# Altium project CW341_KintexUltraScaleTarget.PrjPcb (part 2 of 3)

## Sheet CW341_FPGAIO_5.SchDoc: Kintex IO Banks
size Letter; Organization: NewAE Technology Inc.; Address1: 1083 Queen St., Suite 196; Address2: Halifax; Address3: NS; Address4: Canada B3H 0B2; SheetNumber: 10; SheetTotal: 16; SheetApproved: YES
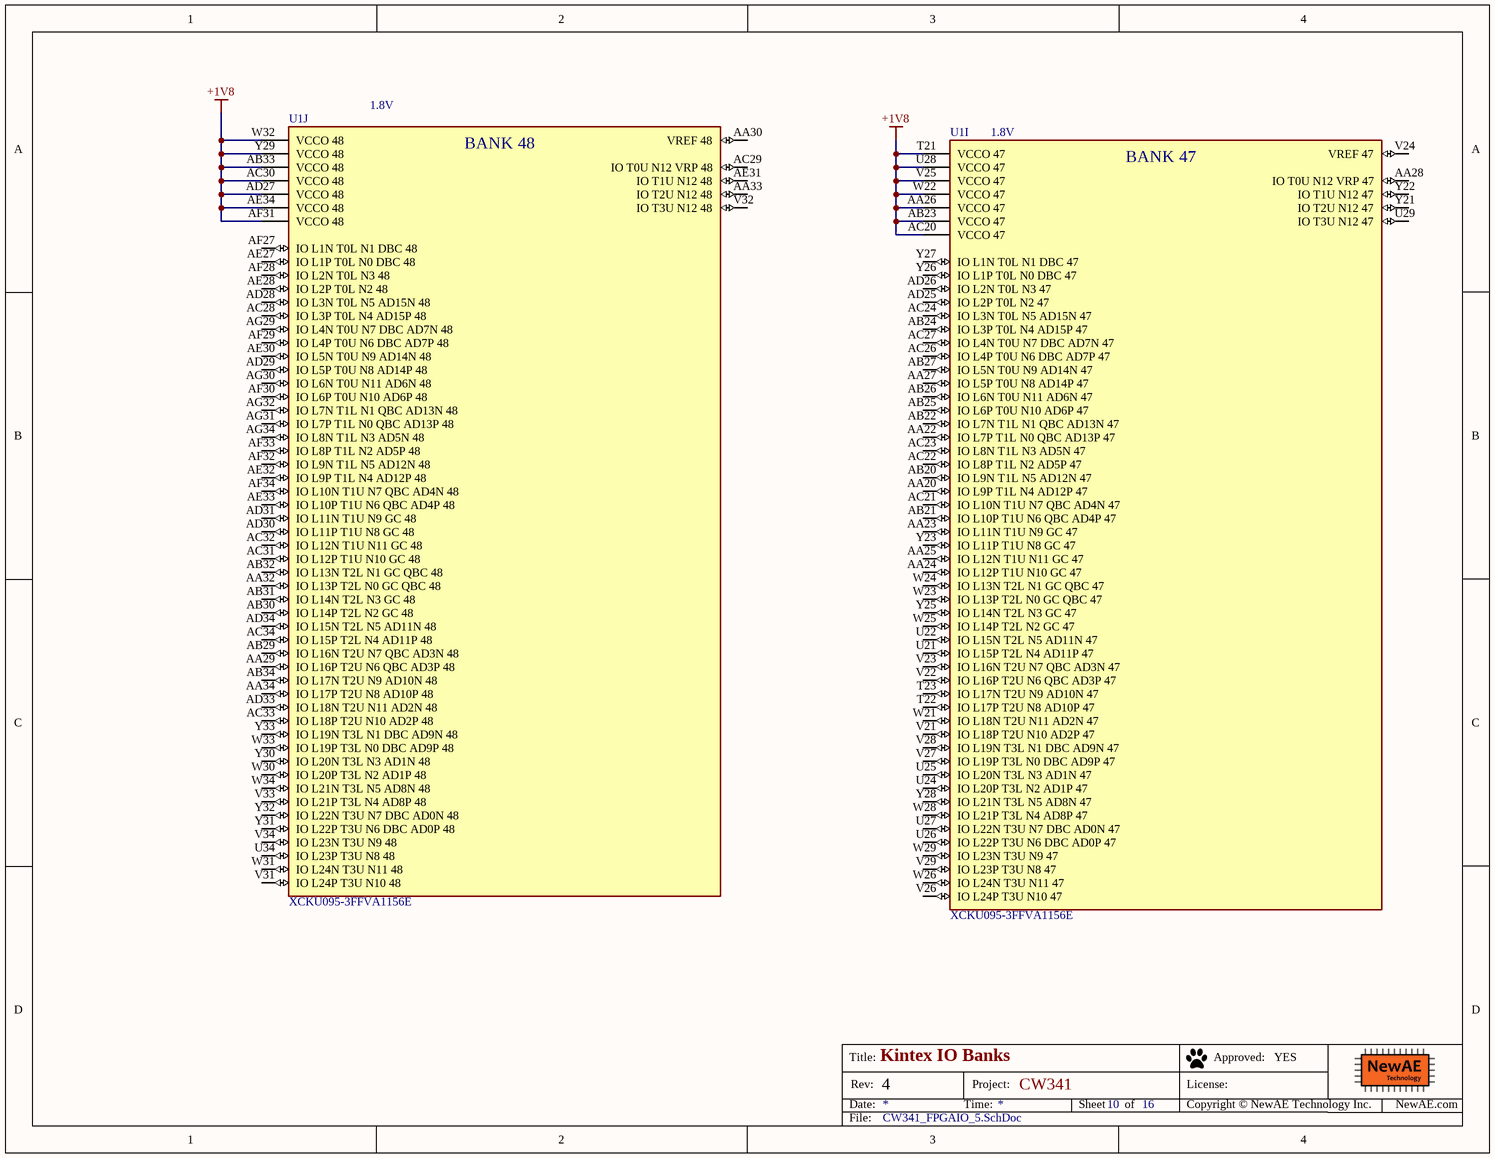
[diagram p9: CW341_FPGAIO_5.SchDoc]

### Parts
U1  XCKU095-3FFVA1156E  [FP-XCKU060-3FFVA1156E-MFG]  (parts I,J of 23)

### Nets
+1V8: U1.AA26(VCCO_47) U1.AB23(VCCO_47) U1.AB33(VCCO_48) U1.AC20(VCCO_47) U1.AC30(VCCO_48) U1.AD27(VCCO_48) U1.AE34(VCCO_48) U1.AF31(VCCO_48) U1.T21(VCCO_47) U1.U28(VCCO_47) U1.V25(VCCO_47) U1.W22(VCCO_47) U1.W32(VCCO_48) U1.Y29(VCCO_48)

Not connected (* = marked no-connect by the designer): U1 AA20(IO_L9P_T1L_N4_AD12P_47) AA22(IO_L7P_T1L_N0_QBC_AD13P_47) AA23(IO_L11N_T1U_N9_GC_47) AA24(IO_L12P_T1U_N10_GC_47) AA25(IO_L12N_T1U_N11_GC_47) AA27(IO_L5P_T0U_N8_AD14P_47) AA28(IO_T0U_N12_VRP_47) AA29(IO_L16P_T2U_N6_QBC_AD3P_48) AA30(VREF_48) AA32(IO_L13P_T2L_N0_GC_QBC_48) AA33(IO_T2U_N12_48) AA34(IO_L17P_T2U_N8_AD10P_48) AB20(IO_L9N_T1L_N5_AD12N_47) AB21(IO_L10P_T1U_N6_QBC_AD4P_47) AB22(IO_L7N_T1L_N1_QBC_AD13N_47) AB24(IO_L3P_T0L_N4_AD15P_47) AB25(IO_L6P_T0U_N10_AD6P_47) AB26(IO_L6N_T0U_N11_AD6N_47) AB27(IO_L5N_T0U_N9_AD14N_47) AB29(IO_L16N_T2U_N7_QBC_AD3N_48) AB30(IO_L14P_T2L_N2_GC_48) AB31(IO_L14N_T2L_N3_GC_48) AB32(IO_L13N_T2L_N1_GC_QBC_48) AB34(IO_L17N_T2U_N9_AD10N_48) AC21(IO_L10N_T1U_N7_QBC_AD4N_47) AC22(IO_L8P_T1L_N2_AD5P_47) AC23(IO_L8N_T1L_N3_AD5N_47) AC24(IO_L3N_T0L_N5_AD15N_47) AC26(IO_L4P_T0U_N6_DBC_AD7P_47) AC27(IO_L4N_T0U_N7_DBC_AD7N_47) AC28(IO_L3P_T0L_N4_AD15P_48) AC29(IO_T0U_N12_VRP_48) AC31(IO_L12P_T1U_N10_GC_48) AC32(IO_L12N_T1U_N11_GC_48) AC33(IO_L18P_T2U_N10_AD2P_48) AC34(IO_L15P_T2L_N4_AD11P_48) AD25(IO_L2P_T0L_N2_47) AD26(IO_L2N_T0L_N3_47) AD28(IO_L3N_T0L_N5_AD15N_48) AD29(IO_L5P_T0U_N8_AD14P_48) AD30(IO_L11P_T1U_N8_GC_48) AD31(IO_L11N_T1U_N9_GC_48) AD33(IO_L18N_T2U_N11_AD2N_48) AD34(IO_L15N_T2L_N5_AD11N_48) AE27(IO_L1P_T0L_N0_DBC_48) AE28(IO_L2P_T0L_N2_48) AE30(IO_L5N_T0U_N9_AD14N_48) AE31(IO_T1U_N12_48) AE32(IO_L9P_T1L_N4_AD12P_48) AE33(IO_L10P_T1U_N6_QBC_AD4P_48) AF27(IO_L1N_T0L_N1_DBC_48) AF28(IO_L2N_T0L_N3_48) AF29(IO_L4P_T0U_N6_DBC_AD7P_48) AF30(IO_L6P_T0U_N10_AD6P_48) AF32(IO_L9N_T1L_N5_AD12N_48) AF33(IO_L8P_T1L_N2_AD5P_48) AF34(IO_L10N_T1U_N7_QBC_AD4N_48) AG29(IO_L4N_T0U_N7_DBC_AD7N_48) AG30(IO_L6N_T0U_N11_AD6N_48) AG31(IO_L7P_T1L_N0_QBC_AD13P_48) AG32(IO_L7N_T1L_N1_QBC_AD13N_48) AG34(IO_L8N_T1L_N3_AD5N_48) T22(IO_L17P_T2U_N8_AD10P_47) T23(IO_L17N_T2U_N9_AD10N_47) U21(IO_L15P_T2L_N4_AD11P_47) U22(IO_L15N_T2L_N5_AD11N_47) U24(IO_L20P_T3L_N2_AD1P_47) U25(IO_L20N_T3L_N3_AD1N_47) U26(IO_L22P_T3U_N6_DBC_AD0P_47) U27(IO_L22N_T3U_N7_DBC_AD0N_47) U29(IO_T3U_N12_47) U34(IO_L23P_T3U_N8_48) V21(IO_L18P_T2U_N10_AD2P_47) V22(IO_L16P_T2U_N6_QBC_AD3P_47) V23(IO_L16N_T2U_N7_QBC_AD3N_47) V24(VREF_47) V26(IO_L24P_T3U_N10_47) V27(IO_L19P_T3L_N0_DBC_AD9P_47) V28(IO_L19N_T3L_N1_DBC_AD9N_47) V29(IO_L23P_T3U_N8_47) V31(IO_L24P_T3U_N10_48) V32(IO_T3U_N12_48) V33(IO_L21P_T3L_N4_AD8P_48) V34(IO_L23N_T3U_N9_48) W21(IO_L18N_T2U_N11_AD2N_47) W23(IO_L13P_T2L_N0_GC_QBC_47) W24(IO_L13N_T2L_N1_GC_QBC_47) W25(IO_L14P_T2L_N2_GC_47) W26(IO_L24N_T3U_N11_47) W28(IO_L21P_T3L_N4_AD8P_47) W29(IO_L23N_T3U_N9_47) W30(IO_L20P_T3L_N2_AD1P_48) W31(IO_L24N_T3U_N11_48) W33(IO_L19P_T3L_N0_DBC_AD9P_48) W34(IO_L21N_T3L_N5_AD8N_48) Y21(IO_T2U_N12_47) Y22(IO_T1U_N12_47) Y23(IO_L11P_T1U_N8_GC_47) Y25(IO_L14N_T2L_N3_GC_47) Y26(IO_L1P_T0L_N0_DBC_47) Y27(IO_L1N_T0L_N1_DBC_47) Y28(IO_L21N_T3L_N5_AD8N_47) Y30(IO_L20N_T3L_N3_AD1N_48) Y31(IO_L22P_T3U_N6_DBC_AD0P_48) Y32(IO_L22N_T3U_N7_DBC_AD0N_48) Y33(IO_L19N_T3L_N1_DBC_AD9N_48)

### Notes on the sheet
- (near U1) 1.8V
- Title:
- Date:
- Rev:
- Time:
- Project:
- Sheet
- of
- License:
- Copyright © NewAE Technology Inc.
- Approved:
- NewAE.com
- File:
- (in symbol IC-XCKU095-1156, part I) BANK 47
- (in symbol IC-XCKU095-1156, part J) BANK 48

### Library data of the parts
U1 = IC-XCKU095-1156: IC FPGA 520 I/O 1156FCBGA; Manufacturer: Xilinx; Manufacturer Part Number: XCKU060-3FFVA1156E; Standoff Height: 0.4mm; Ram Size: 38MBytes; Min Supply Voltage: 0.97V; Max Junction Temp: +100°C; Max Supply Voltage: 1.8V; Number Of Logic Elements Cells: 1176000; Number Of I/Os: 520; Speed Grade: 3; Memory Type: RAM; Ipc Land Pattern Name: BGA1156N100P34X34_3500X3500X342; RoHS: TRUE; Height: 3.51mm; Footprint Url: https://www.xilinx.com/support/documentation/user_guides/ug575-ultrascale-pkg-pinout.pdf; Device Class L2: Embedded Processors and Controllers; ComponentLink2URL: https://www.xilinx.com/support/documentation/data_sheets/ds890-ultrascale-overview.pdf; Temperature Range High: +100°C; Device Class L1: Integrated Circuits (ICs); Package: 0; Octopart: https://octopart.com/xcku035-3ffva1156e-xilinx-67038192?r=sp; Automotive: No; ComponentLink2Description: Datasheet; Device Class L3: FPGAs - Field Programmable Gate Arrays; Category: IC; Lead Free: Yes; Temperature: 0°C to +100°C; Temperature Range Low: 0°C; Digikey Description: IC FPGA 520 I/O 1156FCBGA

## Sheet CW341_HeatsinkFan.SchDoc: Heatsink and Fan
size Letter; Organization: NewAE Technology Inc.; Address1: 1083 Queen St., Suite 196; Address2: Halifax; Address3: NS; Address4: Canada B3H 0B2; SheetNumber: 11; SheetTotal: 16; SheetApproved: YES
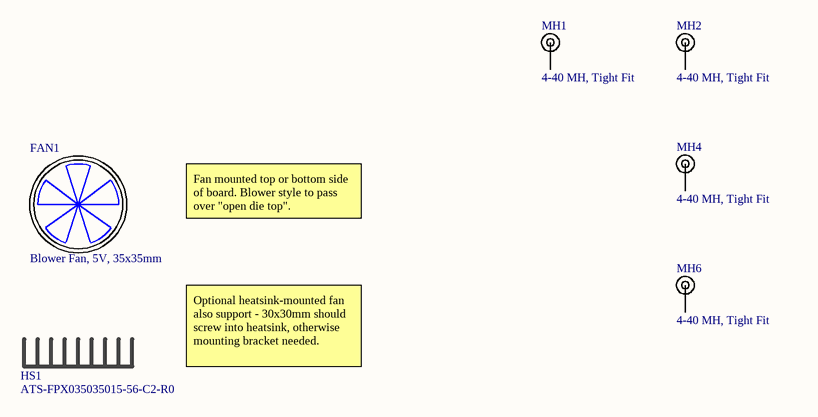
[diagram p10: CW341_HeatsinkFan.SchDoc]

### Parts
FAN1  Blower Fan, 5V, 35x35mm  [BFB03505HHA-A]
HS1  ATS-FPX035035015-56-C2-R0  [ATS-FPX035035015-56-C2-R0]
MH1  4-40 MH, Tight Fit  [MOUNT_#4_TIGHT]
MH2  4-40 MH, Tight Fit  [MOUNT_#4_TIGHT]
MH4  4-40 MH, Tight Fit  [MOUNT_#4_TIGHT]
MH6  4-40 MH, Tight Fit  [MOUNT_#4_TIGHT]

### Nets

Not connected (* = marked no-connect by the designer): HS1 MH; MH1 1; MH2 1; MH4 1; MH6 1

### Notes on the sheet
- Fan mounted top or bottom side of board. Blower style to pass over "open die top".
- Optional heatsink-mounted fan also support - 30x30mm should screw into heatsink, otherwise mounting bracket needed.
- Title:
- Date:
- Rev:
- Time:
- Project:
- Sheet
- of
- License:
- Copyright © NewAE Technology Inc.
- Approved:
- NewAE.com
- File:

### Library data of the parts
FAN1 = BFB03505HHA-A: Manufacture 1: Delta Fans; Component Group: Mechanical; PP Material Stack: 0; Part Number: BFB03505HHA-A; Manufacture Part Number 1: BFB03505HHA-A; Component Kind: Standard; Component Type: Standard; PP Rotation: 0; PP Rotation1: 0
HS1 = ATS-FPX035035015-56-C2-R0: Heatsink, 35mm square; Manufacture 1: ATS; Component Group: Mechanical; PP Material Stack: 0; Part Number: ATS-FPX035035015-56-C2-R0; Manufacture Part Number 1: ATS-FPX035035015-56-C2-R0; Supplier 1: Digi-Key; Component Kind: Standard; Component Type: Standard; PP Rotation: 0; PP Rotation1: 0
MH1 MH2 MH4 MH6 = MOUNT_#4_TIGHT: Machine screw 4-40 Mounting Hole; Component Group: Mechanical; PP Material Stack: 0; Part Number: MOUNT_#4_TIGHT; Pin Count: 1; Component Kind: Mechanical; Component Type: Mechanical; PP Rotation: 0

## Sheet CW341_PowerMeasure.SchDoc: <Enter Sheet Title>
size Letter; Organization: NewAE Technology Inc.; Address1: 1083 Queen St., Suite 196; Address2: Halifax; Address3: NS; Address4: Canada B3H 0B2; SheetNumber: 12; SheetTotal: 16; SheetApproved: NO
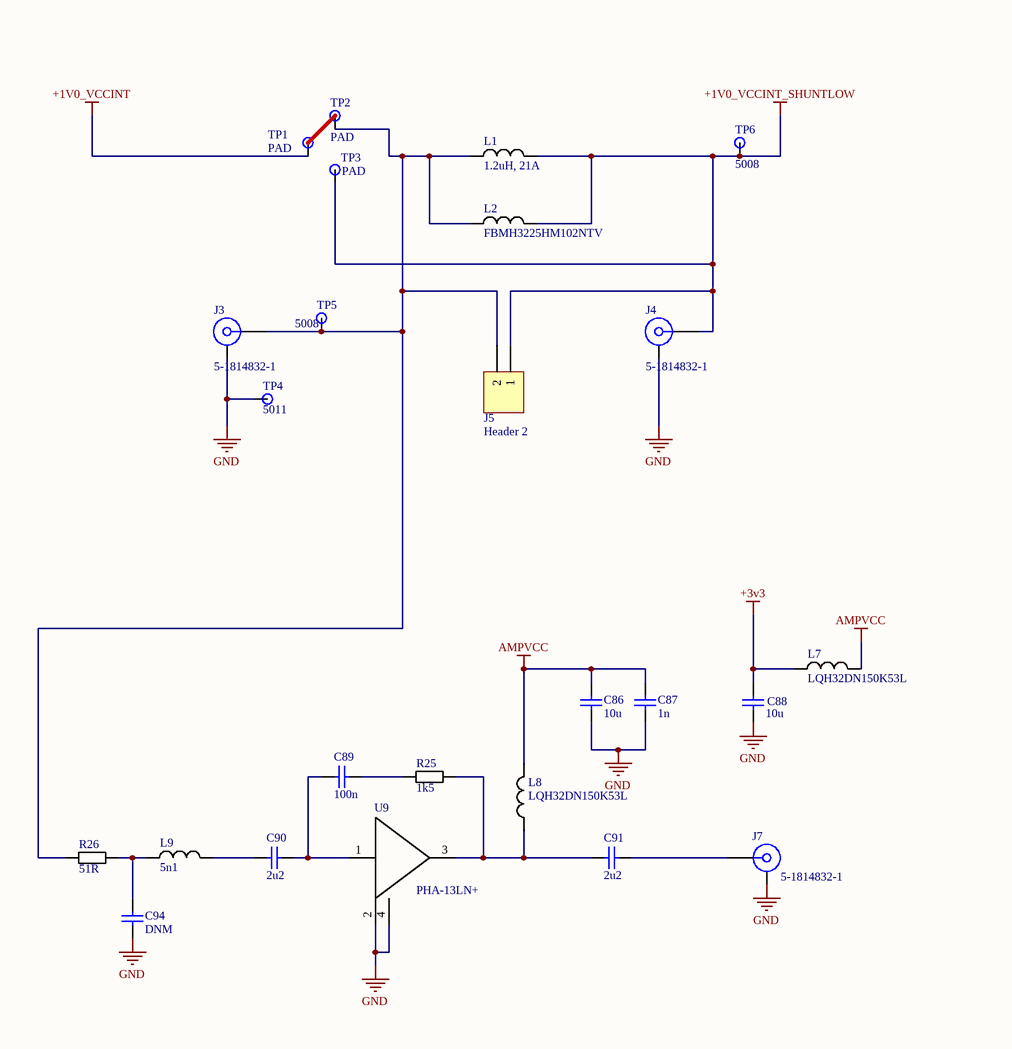
[diagram p11: CW341_PowerMeasure.SchDoc, left]
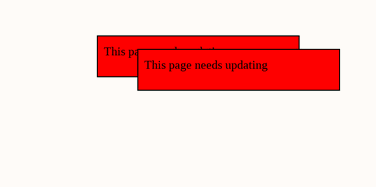
[diagram p12: CW341_PowerMeasure.SchDoc, right]

### Parts
C86  10u  [CAPC0603_M]
C87  1n  [CAPC0603_M]
C88  10u  [CAPC0603_M]
C89  100n  [CAPC0402_M]
C90  2u2  [CAPC0603_M]
C91  2u2  [CAPC0603_M]
C94  DNM  [CAPC0603_M]
J3  5-1814832-1  [SMA_VERT_1.65MMHOLE]
J4  5-1814832-1  [SMA_VERT_1.65MMHOLE]
J5  Header 2  [HDR1X2]
J7  5-1814832-1  [SMA_VERT_1.65MMHOLE]
L1  1.2uH, 21A  [XAL7070-122]
L2  FBMH3225HM102NTV  [INDC3225X06N]
L7  LQH32DN150K53L  [INDC3225X06N]
L8  LQH32DN150K53L  [INDC3225X06N_LQH32]
L9  5n1  [IND_0603]
R25  1k5  [RESC1608X55N]
R26  51R  [RESC1608X55N]
TP1  PAD  [9022-0-00-15-00-00-33-0]
TP2  PAD  [9022-0-00-15-00-00-33-0]
TP3  PAD  [9022-0-00-15-00-00-33-0]
TP4  5011  [KEYSTONE5011]
TP5  5008  [KEYSTONE5008]
TP6  5008  [KEYSTONE5008]
U9  PHA-13LN+  [PHA13LN]

### Nets
+1V0_VCCINT: TP1.1
+1V0_VCCINT_SHUNTLOW: J4.1 J5.1 L1.2 L2.2 TP3.1 TP6.1
+3V3: C88.1 L7.1
AMPVCC: C86.2 C87.2 L7.2 L8.2
GND: C86.1 C87.1 C88.2 C94.2 J3.MH J4.MH J7.MH TP4.1 U9.2(GROUND_1) U9.4(GROUND_2)
NetC89_1: C89.1 C90.2 U9.1(RF-IN)
NetC89_2: C89.2 R25.1
NetC90_1: C90.1 L9.2
NetC91_1: C91.1 L8.1 R25.2 U9.3(RF-OUT_&_DC-IN)
NetC91_2: C91.2 J7.1
NetC94_1: C94.1 L9.1 R26.2
NetJ3_1: J3.1 J5.2 L1.1 L2.1 R26.1 TP2.1 TP5.1

### Notes on the sheet
- This page needs updating
- Title:
- Date:
- Rev:
- Time:
- Project:
- Sheet
- of
- License:
- Copyright © NewAE Technology Inc.
- Approved:
- NewAE.com
- File:

### Library data of the parts
C86 C88 = CCHIP-10u-0603: 10u, 0603; Manufacture Part Number 1: GRM188R61C106MA73D; Component Group: Capacitor; Case-EIA: 0603; Case-Metric: 1608; Part Number: CCHIP-10u-0603; Footprint: 0603; Pin Count: 2; Supplier 1: Digi-Key; Supplier Part Number 1: 490-7201-1-ND; Value: 10u; Mounting Technology: SMT; Component Kind: Standard; Component Type: Standard
C87 = CCHIP-1n-0603: 1n, 0603; Manufacture 1: AVX; Manufacture Part Number 1: 06033D102KAT2A; Component Group: Capacitor; Case-EIA: 0603; Case-Metric: 1608; Rated Voltage: 50VDC; Part Number: CCHIP-1n-0603; Footprint: 0603; Pin Count: 2; Supplier 1: Digi-Key; Value: 1n; Mounting Technology: SMT; Component Kind: Standard; Component Type: Standard
C89 = CCHIP-100n-0402: as C24 on sheet CW341_FPGA_DECOUP; Part Number: CCHIP-100n-0402; Footprint: 0402; Pin Count: 2; Supplier 1: Digi-Key; Supplier Part Number 1: 445-6901-1-ND; Value: 100n; Mounting Technology: SMT; Component Kind: Standard; Component Type: Standard
C90 C91 = CCHIP-2u2-0603: 2u2, 0603; Manufacture 1: Samsung; Manufacture Part Number 1: CL10B225KP8NNNC; Component Group: Capacitor; Case-EIA: 0603; Case-Metric: 1608; Rated Voltage: 10VDC; Part Number: CCHIP-2u2-0603; Footprint: 0603; Pin Count: 2; Supplier 1: Digi-Key; Supplier Part Number 1: 1276-1134-1-ND; Value: 2u2; Mounting Technology: SMT; Component Kind: Standard; Component Type: Standard
C94 = CCHIP-DNM-0603: DNM, 0603; Component Group: Capacitor; Case-EIA: 0603; Part Number: CCHIP-DNM-0603; Footprint: 0603; Pin Count: 2; Value: DNM; Mounting Technology: SMT; Component Kind: Standard; Component Type: Standard
J3 J4 J7 = 5-1814832-1: SMA, Vert; Manufacture 1: TE Connectivity; Component Group: Connector; Part Number: 5-1814832-1; Manufacture Part Number 1: 5-1814832-1; Pin Count: 2; Supplier 1: Digi-Key; Supplier Part Number 1: A97594-ND; Component Kind: Standard; Component Type: Standard
J5 = Header 2: Header, 2-Pin; LatestRevisionDate: 17-Jul-2002; LatestRevisionNote: Re-released for DXP Platform.; Publisher: Altium Limited
L1 = XAL7070-122MEB: 1.2uH, 21A RMS; Manufacture 1: Coilcraft; Component Group: Inductor; PP Material Stack: 0; Part Number: XAL7070-122MEB; Footprint: XAL7070; Manufacture Part Number 1: XAL7070-122MEB; Pin Count: 2; Supplier 1: Mouser; Value: 1.2uH, 21A; Component Kind: Standard; Component Type: Standard; PP Rotation: 0; PP Rotation1: 0
L2 = FBCHIP-1K-1210: Ferrite Bead, 1K@100MHz, 2A, 1210, 100mOhm DC, AEC-Q200; Manufacture 1: Taiyo Yuden; Component Group: Inductor; Case-EIA: 1210; Case-Metric: 3225; PP Material Stack: 0; Part Number: FBCHIP-1K-1210; Footprint: 1210; Manufacture Part Number 1: FBMH3225HM102NTV; Pin Count: 2; Supplier 1: Digi-Key; Supplier Part Number 1: 587-3835-1-ND; Value: 1k@100MHz; Mounting Technology: SMT; RoHS: Yes; Temperature Range: -40C to 125C; Component Kind: Standard; Component Type: Standard; PP Rotation: 0
L7 = FBCHIP-1K-1210: Ferrite Bead, 1K@100MHz, 2A, 1210, 100mOhm DC, AEC-Q200; Manufacture 1: Taiyo Yuden; Manufacture Part Number 1: FBMH3225HM102NTV; Component Group: Inductor; Case-EIA: 1210; Case-Metric: 3225; PP Material Stack: 0; Part Number: FBCHIP-1K-1210; Footprint: 1210; Pin Count: 2; Supplier 1: Digi-Key; Supplier Part Number 1: 587-3835-1-ND; Value: 1k@100MHz; Mounting Technology: SMT; RoHS: Yes; Temperature Range: -40C to 125C; Component Kind: Standard; Component Type: Standard; PP Rotation: 0
L8 = LQH32DN150K53L: 15uH, 300mA, 1210 Inductor; Manufacture 1: Murata Electronics; Case-EIA: 1210; Case-Metric: 3225; PP Material Stack: 0; Part Number: LQH32DN150K53L; Component Group: Inductor; Footprint: 1210; Manufacture Part Number 1: LQH32DN150K53L; Pin Count: 2; Supplier 1: Digi-Key; Supplier Part Number 1: 490-9909-1-ND; Mounting Technology: SMT; RoHS: Yes; Temperature Range: -40C to 125C; Component Kind: Standard; Component Type: Standard; PP Rotation: 0
L9 = LCHIP-5N1-0603: FIXED IND 5.1nH; Manufacture 1: Coilcraft; Manufacture Part Number 1: 0603CS-5N1XJLU; Component Group: Inductor; Case-EIA: 0603; Case-Metric: 1608; Tolerance: ±5%; PP Material Stack: 0; Part Number: LCHIP-5N1-0603; Footprint: 0603; Pin Count: 2; Supplier 1: Mouser; Supplier Part Number 1: 994-0603CS-5N1XJLU; Value: 5n1; Mounting Technology: SMT; Component Kind: Standard; Component Type: Standard; PP Rotation: 0
R25 = RCHIP-1K5-0603: 1k5 res, 0603, 1%, 1/10W; Manufacture 1: Yageo; Manufacture Part Number 1: RC0603FR-071K5L; Component Group: Resistor; Case-EIA: 0603; Case-Metric: 1608; Rated Power: 0.1W; Rated Voltage: 75VDC; Part Number: RCHIP-1K5-0603; Footprint: 0603; Pin Count: 2; Supplier 1: Digi-Key; Supplier Part Number 1: 311-1.50KHRCT-ND; Value: 1k5; Tolerance: 1%; Mounting Technology: SMT; Temperature Range: -55C to 155C; Component Kind: Standard; Component Type: Standard
R26 = RCHIP-51R-0603: 51R res, 0603, 1%, 1/10W; Manufacture 1: Yageo; Manufacture Part Number 1: RC0603FR-0751RL; Component Group: Resistor; Case-EIA: 0603; Case-Metric: 1608; Rated Power: 0.1W; Rated Voltage: 75VDC; Part Number: RCHIP-51R-0603; Footprint: 0603; Pin Count: 2; Supplier 1: Digi-Key; Supplier Part Number 1: 311-51.0HRCT-ND; Value: 51R; Tolerance: 1%; Mounting Technology: SMT; Temperature Range: -55C to 155C; Component Kind: Standard; Component Type: Standard
TP1-TP3 = TESTPAD_9022-0-00-15-00-00-33-0: Manufacture 1: Mill-Max Manufacturing Corp.; Component Group: Test Point; Part Number: TESTPAD_9022-0-00-15-00-00-33-0; Manufacture Part Number 1: 9022-0-00-15-00-00-33-0; Pin Count: 1; Supplier 1: Digi-Key; Supplier Part Number 1: ED90411-ND; Mounting Technology: Through-hole; Component Kind: Standard; Component Type: Standard
TP4 = KEYSTONE_5011: TEST POINT PC MULTI PURPOSE BLK; Part Number: KEYSTONE_5011; Component Group: Test Point; Pin Count: 1; Supplier 1: Digi-Key; Supplier Part Number 1: 36-5011-ND; Mounting Technology: Through-hole; Component Kind: Standard; Component Type: Standard
TP5 TP6 = KEYSTONE_5008: TEST POINT PC COMPACT .063"D ORG; Part Number: KEYSTONE_5008; Component Group: Test Point; Pin Count: 1; Supplier 1: Digi-Key; Supplier Part Number 1: 36-5008-ND; Mounting Technology: Through-hole; Component Kind: Standard; Component Type: Standard
U9 = PHA-13LN+: Integrated Circuit; Manufacturer_Name: Mini-Circuits; Datasheet Link: https://www.minicircuits.com/pdfs/PHA-13LN+.pdf; Height: 1.6mm; Manufacturer_Part_Number: PHA-13LN+; Mouser Part Number: 139-PHA-13LN; Mouser Price/Stock: https://www.mouser.co.uk/ProductDetail/Mini-Circuits/PHA-13LN%2b?qs=xZ%2FP%252Ba9zWqYkwnUBoTp7PQ%3D%3D

## Sheet CW341_SRAM.SchDoc: CW341 SRAM
size Letter; Organization: NewAE Technology Inc.; Address1: 1083 Queen St., Suite 196; Address2: Halifax; Address3: NS; Address4: Canada B3H 0B2; SheetNumber: 13; SheetTotal: 15; SheetApproved: NO
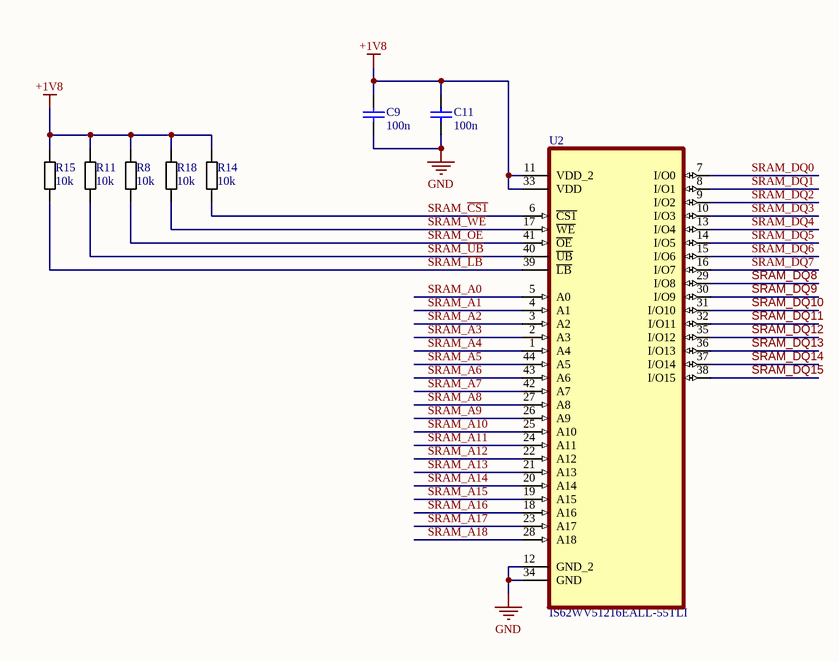
[diagram p13: CW341_SRAM.SchDoc]

### Parts
C9  100n  [CAPC0402_M]
C11  100n  [CAPC0402_M]
R8  10k  [RESC1005X40N]
R11  10k  [RESC1005X40N]
R14  10k  [RESC1005X40N]
R15  10k  [RESC1005X40N]
R18  10k  [RESC1005X40N]
U2  SRAM - 8Mb (1M x 8) Parallel  55ns 44-TSOP II  [TSOP80P1180X120-44M]  (value not drawn)

### Nets
+1V8: C9.1 C11.1 R8.1 R11.1 R14.1 R15.1 R18.1 U2.11(VDD_2) U2.33(VDD)
GND: C9.2 C11.2 U2.12(GND_2) U2.34(GND)
SRAM_A0: U2.5(A0)
SRAM_A1: U2.4(A1)
SRAM_A2: U2.3(A2)
SRAM_A3: U2.2(A3)
SRAM_A4: U2.1(A4)
SRAM_A5: U2.44(A5)
SRAM_A6: U2.43(A6)
SRAM_A7: U2.42(A7)
SRAM_A8: U2.27(A8)
SRAM_A9: U2.26(A9)
SRAM_A10: U2.25(A10)
SRAM_A11: U2.24(A11)
SRAM_A12: U2.22(A12)
SRAM_A13: U2.21(A13)
SRAM_A14: U2.20(A14)
SRAM_A15: U2.19(A15)
SRAM_A16: U2.18(A16)
SRAM_A17: U2.23(A17)
SRAM_A18: U2.28(A18)
SRAM_~{CS1}: R14.2 U2.6(~{CS1})
SRAM_DQ0: U2.7(I/O0)
SRAM_DQ1: U2.8(I/O1)
SRAM_DQ2: U2.9(I/O2)
SRAM_DQ3: U2.10(I/O3)
SRAM_DQ4: U2.13(I/O4)
SRAM_DQ5: U2.14(I/O5)
SRAM_DQ6: U2.15(I/O6)
SRAM_DQ7: U2.16(I/O7)
SRAM_DQ8: U2.29(I/O8)
SRAM_DQ9: U2.30(I/O9)
SRAM_DQ10: U2.31(I/O10)
SRAM_DQ11: U2.32(I/O11)
SRAM_DQ12: U2.35(I/O12)
SRAM_DQ13: U2.36(I/O13)
SRAM_DQ14: U2.37(I/O14)
SRAM_DQ15: U2.38(I/O15)
SRAM_~{LB}: R15.2 U2.39(~{LB})
SRAM_~{OE}: R8.2 U2.41(~{OE})
SRAM_~{UB}: R11.2 U2.40(~{UB})
SRAM_~{WE}: R18.2 U2.17(~{WE})

### Notes on the sheet
- Title:
- Date:
- Rev:
- Time:
- Project:
- Sheet
- of
- License:
- Copyright © NewAE Technology Inc.
- Approved:
- NewAE.com
- File:

### Library data of the parts
C9 C11 = CCHIP-100n-0402: as C24 on sheet CW341_FPGA_DECOUP; Part Number: CCHIP-100n-0402; Footprint: 0402; Pin Count: 2; Value: 100n; Mounting Technology: SMT; Component Kind: Standard; Component Type: Standard; Supplier 1: Digi-Key; Supplier Part Number 1: 445-6901-1-ND
R8 R11 R14 R15 R18 = RCHIP-10K-0402: 10k res, 0402, 1%, 1/16W; Manufacture 1: Yageo; Manufacture Part Number 1: RC0402FR-0710KL; Component Group: Resistor; Case-EIA: 0402; Case-Metric: 1005; Rated Power: 0.063W; Rated Voltage: 75VDC; Part Number: RCHIP-10K-0402; Footprint: 0402; Pin Count: 2; Supplier 1: Digi-Key; Supplier Part Number 1: 311-10.0KLRCT-ND; Value: 10k; Tolerance: 1%; Mounting Technology: SMT; Temperature Range: -55C to 155C; Component Kind: Standard; Component Type: Standard
U2 = IS62WV51216EALL-55TLI: IC SRAM 8M PARALLEL 44TSOP II; Manufacture 1: Alliance Memory; Operating Supply Voltage: 3V; Address Bus Width: 20b; Max Supply Voltage: 2.2V; Min Supply Voltage: 1.65V; Memory Type: RAM,SRAM - Asynchronous,SDR; Max Supply Current: 60mA; Number of Ports: 1; Component Group: Digital IC; PP Material Stack: 0; Supplier 1: Digi-Key; RoHS: Yes; Category: RAM; Stock 1: 1798; Pricing 1: 1=6.76000, 10=6.21600, 25=6.08640, 50=6.06560, 135=5.44252, 270=5.27800, 540=5.01900, 1080=4.84400, 5130=4.35750 (USD); Mount: Surface Mount; Case/Package: TSOP; Number of Pins: 44; Min Operating Temperature: -40°C; Max Operating Temperature: 85°C; Package Quantity: 135; Interface: Parallel; Density: 8Mb; Access Time: 55ns; Packaging: Tray; Memory Size: 8Mb; Length: 18.42mm; Width: 10.16mm; Height: 1mm; Radiation Hardening: No; REACH SVHC: No SVHC; Lead Free: Lead Free; ComponentLink3URL: https://datasheet.ciiva.com/9274/as6c8008-9274921.pdf?src-supplier=Avnet; ComponentLink3Description: https://datasheet.ciiva.com/9274/as6c8008-9274921.pdf?src-supplier=Avnet; ComponentLink4URL: https://datasheet.ciiva.com/1510/32786-1510631.pdf?src-supplier=Element14; ComponentLink4Description: https://datasheet.ciiva.com/1510/32786-1510631.pdf?src-supplier=Element14; Supplier Part Number 1: 1450-1039-ND; .Checked SCH: *; .Checked PCB: *; Part Number: IS62WV51216EALL-55TLI; Footprint: TSSOP-44; Manufacture Part Number 1: IS62WV51216EALL-55TLI; Pin Count: 44; Mounting Technology: SMT; Component Kind: Standard; Component Type: Standard; PP Rotation: 0; Manufacturer Part Number: IS62WV51216EALL-55TLI

## Sheet CW341_XADC.SchDoc: CW341 XADC
size Letter; Organization: NewAE Technology Inc.; Address1: 1083 Queen St., Suite 196; Address2: Halifax; Address3: NS; Address4: Canada B3H 0B2; SheetNumber: 14; SheetTotal: 16; SheetApproved: NO
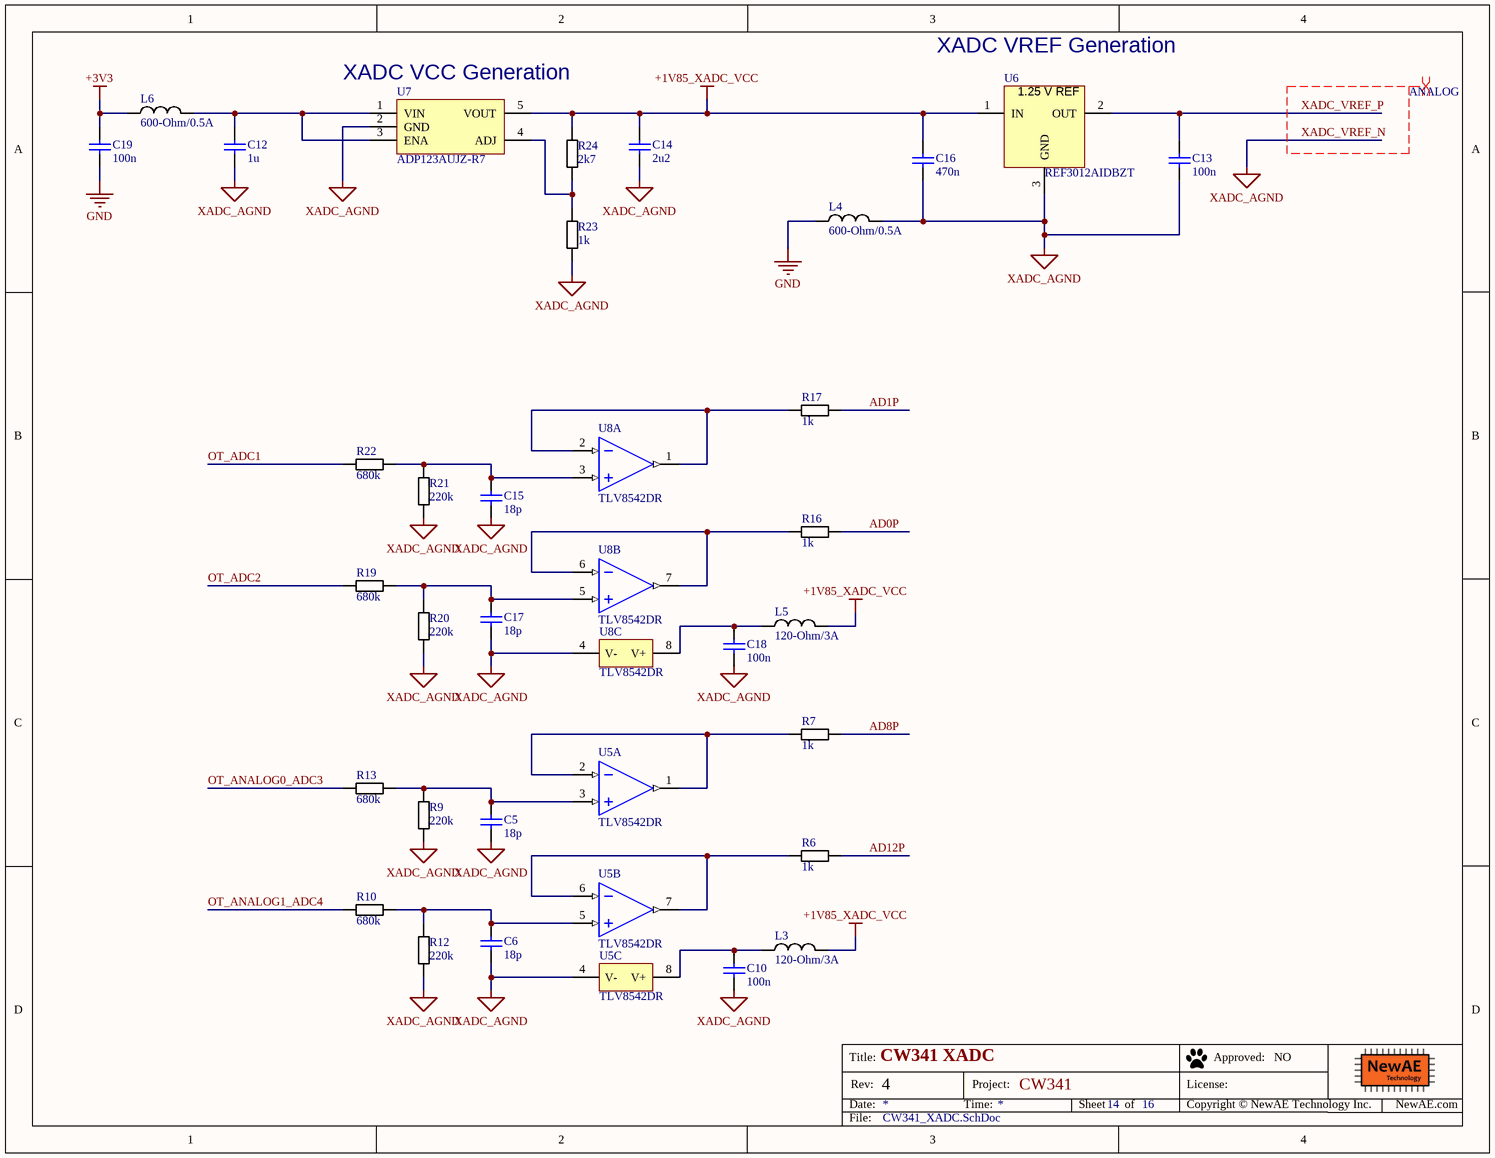
[diagram p14: CW341_XADC.SchDoc]

### Parts
C5  18p  [CAPC0402_M]
C6  18p  [CAPC0402_M]
C10  100n  [CAPC0402_M]
C12  1u  [CAPC0603_M]
C13  100n  [CAPC0402_M]
C14  2u2  [CAPC0603_M]
C15  18p  [CAPC0402_M]
C16  470n  [CAPC0603_M]
C17  18p  [CAPC0402_M]
C18  100n  [CAPC0402_M]
C19  100n  [CAPC0402_M]
L3  120-Ohm/3A  [IND_0603]
L4  600-Ohm/0.5A  [IND_0603]
L5  120-Ohm/3A  [IND_0603]
L6  600-Ohm/0.5A  [IND_0603]
R6  1k  [RESC1005X40N]
R7  1k  [RESC1005X40N]
R9  220k  [RESC1005X40N]
R10  680k  [RESC1005X40N]
R12  220k  [RESC1005X40N]
R13  680k  [RESC1005X40N]
R16  1k  [RESC1005X40N]
R17  1k  [RESC1005X40N]
R19  680k  [RESC1005X40N]
R20  220k  [RESC1005X40N]
R21  220k  [RESC1005X40N]
R22  680k  [RESC1005X40N]
R23  1k  [RESC1005X40N]
R24  2k7  [RESC1005X40N]
U5  TLV8542DR  [SOIC127P600X175-8N]  (parts A,B,C of 3)
U6  REF3012AIDBZT  [SOT95P237X112-3N]
U7  Linear Voltage Regulator IC  1 Output  300mA TSOT-5  [SOT23-5P95_285X145L45X40]  (value not drawn)
U8  TLV8542DR  [SOIC127P600X175-8N]  (parts A,B,C of 3)

### Nets
+1V85_XADC_VCC: C14.1 C16.1 L3.2 L5.2 R24.1 U6.1(IN) U7.5(VOUT)
+3V3: C19.1 L6.1
GND: C19.2 L4.1
XADC_VREF_N: C5.2 C6.2 C10.2 C12.2 C13.2 C14.2 C15.2 C16.2 C17.2 C18.2 L4.2 R9.2 R12.2 R20.2 R21.2 R23.2 U5.4(V-) U6.3(GND) U7.2(GND) U8.4(V-)  [also labelled XADC_AGND]
AD0P: R16.2
AD1P: R17.2
AD8P: R7.2
AD12P: R6.2
OT_ADC1: R22.1
OT_ADC2: R19.1
OT_ANALOG0_ADC3: R13.1
OT_ANALOG1_ADC4: R10.1
XADC_VREF_P: C13.1 U6.2(OUT)
NetC5_1: C5.1 R9.1 R13.2 U5.3(1_IN+)
NetC6_1: C6.1 R10.2 R12.1 U5.5(2_IN+)
NetC10_1: C10.1 L3.1 U5.8(V+)
NetC12_1: C12.1 L6.2 U7.1(VIN) U7.3(ENA)
NetC15_1: C15.1 R21.1 R22.2 U8.3(1_IN+)
NetC17_1: C17.1 R19.2 R20.1 U8.5(2_IN+)
NetC18_1: C18.1 L5.1 U8.8(V+)
NetR6_1: R6.1 U5.6(2_IN-) U5.7(2_Out)
NetR7_1: R7.1 U5.1(1_Out) U5.2(1_IN-)
NetR16_1: R16.1 U8.6(2_IN-) U8.7(2_Out)
NetR17_1: R17.1 U8.1(1_Out) U8.2(1_IN-)
NetR23_1: R23.1 R24.2 U7.4(ADJ)

### Layout directives
differential pair; differential pair class ANALOG: XADC_VREF_N, XADC_VREF_P

### Notes on the sheet
- (near U7) XADC VCC Generation
- XADC VREF Generation
- Title:
- Date:
- Rev:
- Time:
- Project:
- Sheet
- of
- License:
- Copyright © NewAE Technology Inc.
- Approved:
- NewAE.com
- File:
- (in symbol REF3012AIDBZT) 1.25 V REF

### Library data of the parts
C5 C6 C15 C17 = CCHIP-18p-0402: 18p, 0402; Manufacture Part Number 1: GRM1555C1H180JA01D; Component Group: Capacitor; Case-EIA: 0402; Part Number: CCHIP-18p-0402; Footprint: 0402; Pin Count: 2; Supplier 1: Digi-Key; Supplier Part Number 1: 490-5858-1-ND; Value: 18p; Mounting Technology: SMT; Component Kind: Standard; Component Type: Standard
C10 C13 C18 C19 = CCHIP-100n-0402: 100n, 0402; Manufacture Part Number 1: CGA2B3X7R1V104K050BB; Component Group: Capacitor; Case-EIA: 0402; Part Number: CCHIP-100n-0402; Footprint: 0402; Pin Count: 2; Value: 100n; Mounting Technology: SMT; Component Kind: Standard; Component Type: Standard; Supplier 1: Digi-Key; Supplier Part Number 1: 445-6901-1-ND
C12 = CCHIP-1u-0603: 1u, 0603, 50V; Manufacture Part Number 1: CL10A105KB8NNNC; Component Group: Capacitor; Case-EIA: 0603; Case-Metric: 1608; Rated Voltage: 50VDC; Part Number: CCHIP-1u-0603; Footprint: 0603; Pin Count: 2; Supplier 1: Digi-Key; Supplier Part Number 1: 1276-1860-1-ND; Value: 1u; Mounting Technology: SMT; Component Kind: Standard; Component Type: Standard
C14 = CCHIP-2u2-0603-25V: 2u2, 0603; Manufacture 1: Murata Electronics North America; Manufacture Part Number 1: GRM188R61E225MA12D; Component Group: Capacitor; Case-EIA: 0603; Case-Metric: 1608; Rated Voltage: 25VDC; Tolerance: ±20%; Part Number: CCHIP-2u2-0603-25V; Footprint: 0603; Pin Count: 2; Supplier 1: Digi-Key; Supplier Part Number 1: 490-12738-1-ND; Value: 2u2; Mounting Technology: SMT; RoHS: Yes; Component Kind: Standard; Component Type: Standard
C16 = CCHIP-470n-0603-50V: 470n, 0603, 50V; Manufacture 1: Taiyo Yuden; Manufacture Part Number 1: UMK107B7474KA-TR; Component Group: Capacitor; Case-EIA: 0603; Rated Voltage: 50VDC; Part Number: CCHIP-470n-0603-50V; Footprint: 0603; Pin Count: 2; Supplier 1: Digi-Key; Supplier Part Number 1: 587-3170-1-ND; Value: 470n; Mounting Technology: SMT; RoHS: Yes; Temperature Range: -55C to 125C; Component Kind: Standard; Component Type: Standard
L3 L5 = FBCHIP-120R-0603: 120 Ohm @ 100 MHz, 3A rated FB; Manufacture 1: Murata Electronics; Manufacture Part Number 1: BLM18SG121TN1D; Component Group: Inductor; Value: 120R/3A; Case-EIA: 0603; Case-Metric: 1680; PP Material Stack: 0; Part Number: FBCHIP-120R-0603; Footprint: 0603; Pin Count: 2; Supplier 1: Digi-Key; Supplier Part Number 1: 490-3996-1-ND; Rated Power: 3A; Component Kind: Standard; Component Type: Standard; PP Rotation: 0
L4 L6 = FBCHIP-600R-0603: 600 Ohm @ 100 MHz, 0.5A rated FB; Manufacture 1: Murata Electronics; Manufacture Part Number 1: BLM18AG601SN1D; Component Group: Inductor; Value: 600R/0.5A; Case-EIA: 0603; Case-Metric: 1608; PP Material Stack: 0; Part Number: FBCHIP-600R-0603; Footprint: 0603; Pin Count: 2; Supplier 1: Digi-Key; Supplier Part Number 1: 490-1014-2-ND; Rated Power: 0.5A; Component Kind: Standard; Component Type: Standard; PP Rotation: 0
R6 R7 R16 R17 R23 = RCHIP-1K-0402: 1k res, 0402, 1%, 1/16W; Manufacture 1: Yageo; Manufacture Part Number 1: RC0402FR-071KL; Component Group: Resistor; Case-EIA: 0402; Case-Metric: 1005; Rated Power: 0.063W; Rated Voltage: 75VDC; Part Number: RCHIP-1K-0402; Footprint: 0402; Pin Count: 2; Supplier 1: Digi-Key; Supplier Part Number 1: 311-1.00KLRCT-ND; Value: 1k; Tolerance: 1%; Mounting Technology: SMT; Temperature Range: -55C to 155C; Component Kind: Standard; Component Type: Standard
R9 R12 R20 R21 = RCHIP-220K-0402: 220k res, 0402, 1%, 1/16W; Manufacture 1: Yageo; Manufacture Part Number 1: RC0402FR-07220KL; Component Group: Resistor; Case-EIA: 0402; Case-Metric: 1005; Rated Power: 0.063W; Rated Voltage: 75VDC; Part Number: RCHIP-220K-0402; Footprint: 0402; Pin Count: 2; Supplier 1: Digi-Key; Supplier Part Number 1: 311-220KLRCT-ND; Value: 220k; Tolerance: 1%; Mounting Technology: SMT; Temperature Range: -55C to 155C; Component Kind: Standard; Component Type: Standard
R10 R13 R19 R22 = RCHIP-680K-0402: 680k res, 0402, 1%, 1/16W; Manufacture 1: Yageo; Manufacture Part Number 1: RC0402FR-07680KL; Component Group: Resistor; Case-EIA: 0402; Case-Metric: 1005; Rated Power: 0.063W; Rated Voltage: 75VDC; Part Number: RCHIP-680K-0402; Footprint: 0402; Pin Count: 2; Supplier 1: Digi-Key; Supplier Part Number 1: YAG3211CT-ND; Value: 680k; Tolerance: 1%; Mounting Technology: SMT; Temperature Range: -55C to 155C; Component Kind: Standard; Component Type: Standard
R24 = RCHIP-2K7-0402: 2k7 res, 0402, 1%, 1/16W; Manufacture 1: Yageo; Manufacture Part Number 1: RC0402FR-072K7L; Component Group: Resistor; Case-EIA: 0402; Case-Metric: 1005; Rated Power: 0.063W; Rated Voltage: 75VDC; Part Number: RCHIP-2K7-0402; Footprint: 0402; Pin Count: 2; Supplier 1: Digi-Key; Supplier Part Number 1: 311-2.70KLRCT-ND; Value: 2k7; Tolerance: 1%; Mounting Technology: SMT; Temperature Range: -55C to 155C; Component Kind: Standard; Component Type: Standard
U5 U8 = LM2904_SOIC8: IC OP-AMP GP; Manufacture 1: Texas Instruments; Component Group: Analog IC; PP Material Stack: 0; Part Number: LM2904_SOIC8; Footprint: SOIC8; Manufacture Part Number 1: TLV8542DR; Pin Count: 8; Supplier 1: Digi-Key; Supplier Part Number 1: 296-48991-1-ND; Mounting Technology: SMT; RoHS: Yes; Component Kind: Standard; Component Type: Standard; PP Rotation: 0
U6 = REF3012AIDBZT: IC VREF SERIES 0.2% SOT23-3; Manufacture 1: Texas Instruments; Output Voltage: 1.25V; Max Input Voltage: 5.5V; Max Output Current: 25mA; Min Input Voltage: 1.8V; Nominal Supply Current: 42uA; Temperature Coefficient: 50ppm/°C; Number of Channels: 1; Quiescent Current: 50uA; Min Output Voltage: 1.248V; Reference Type: Series,Fixed; Component Group: Analog IC; PP Material Stack: 0; Supplier 1: Digi-Key; RoHS: Yes; Category: Voltage References; Stock 1: 7831; Pricing 1: 1=1.18000, 10=1.05300, 25=0.99960, 100=0.76760 (USD); Case/Package: SOT-23; Number of Pins: 3; Min Operating Temperature: -40°C; Max Operating Temperature: 125°C; Packaging: Tape and Reel; Package Quantity: 1; Output Current: 25mA; Max Supply Current: 50uA; Max Output Voltage: 1.25V; Reference Voltage: 1.25V; Termination: SMD/SMT; Length: 2.92mm; Width: 1.3mm; Height: 1mm; Radiation Hardening: No; REACH SVHC: No SVHC; Lead Free: Lead Free; ComponentLink3URL: https://datasheet.ciiva.com/2007/ref3012-2007154.pdf?src-supplier=Digi-Key; ComponentLink3Description: https://datasheet.ciiva.com/2007/ref3012-2007154.pdf?src-supplier=Digi-Key; ComponentLink4URL: https://datasheet.ciiva.com/2007/ref3012-2007155.pdf?src-supplier=Digi-Key; ComponentLink4Description: https://datasheet.ciiva.com/2007/ref3012-2007155.pdf?src-supplier=Digi-Key; ComponentLink5URL: https://datasheet.ciiva.com/3235/ref3033-3235533.pdf?src-supplier=Avnet; ComponentLink5Description: https://datasheet.ciiva.com/3235/ref3033-3235533.pdf?src-supplier=Avnet; ComponentLink6URL: https://datasheet.ciiva.com/3235/ref3033-3235534.pdf?src-supplier=Avnet; ComponentLink6Description: https://datasheet.ciiva.com/3235/ref3033-3235534.pdf?src-supplier=Avnet; .Checked SCH: *; .Checked PCB: *; Supplier Part Number 1: REF3012AIDBZTTR-ND; Manufacturer Part Number: REF3012AIDBZT; Part Number: REF3012AIDBZT; Footprint: SOT23-3; Manufacture Part Number 1: REF3012AIDBZT; Pin Count: 3; Mounting Technology: SMT; Component Kind: Standard; Component Type: Standard; PP Rotation: 0
U7 = ADP123AUJZ-R7: IC REG LIN POS ADJ 300MA TSOT5; Manufacture 1: Analog Devices Inc.; Dropout Voltage: 85mV; Output Voltage: 5V; Number of Outputs: 1; Max Input Voltage: 5.5V; Min Input Voltage: 2.3V; Min Current Limit: 350mA; Polarity: Positive; Quiescent Current: 45uA; Reference Voltage: 500mV; Min Output Voltage: 800mV; Accuracy: 1%; Power Supply Rejection Ratio (PSRR): 60dB; Max Supply Current: 170uA; Output Type: Adjustable; Component Group: Analog IC; PP Material Stack: 0; Supplier 1: Digi-Key; Category: Voltage Regulators - Linear; Stock 1: 14167; Pricing 1: 1=1.16000, 10=1.03300, 25=0.98000, 100=0.75250, 250=0.66500, 500=0.63000, 1000=0.49000 (USD); Case/Package: TSOT; Number of Pins: 5; Contact Plating: Tin,Matte; Min Operating Temperature: -40°C; Max Operating Temperature: 125°C; Output Current: 300mA; Max Output Current: 300mA; Packaging: Tape and Reel; Number of Regulators: 1; Max Output Voltage: 5V; Output Voltage Accuracy: 1%; Nominal Supply Current: 45uA; Operating Supply Current: 45uA; Length: 2.9mm; Width: 1.6mm; Height: 0.9mm; REACH SVHC: No SVHC; Lead Free: Contains Lead; ComponentLink3URL: https://datasheet.ciiva.com/2040/adp122-123-2040698.pdf?src-supplier=Digi-Key; ComponentLink3Description: https://datasheet.ciiva.com/2040/adp122-123-2040698.pdf?src-supplier=Digi-Key; ComponentLink4URL: https://datasheet.ciiva.com/2040/adp122-123-2040699.pdf?src-supplier=Digi-Key; ComponentLink4Description: https://datasheet.ciiva.com/2040/adp122-123-2040699.pdf?src-supplier=Digi-Key; Supplier Part Number 1: ADP123AUJZ-R7TR-ND; .Checked SCH: *; .Checked PCB: *; Manufacturer Part Number: ADP123AUJZ-R7; Part Number: ADP123AUJZ-R7; Manufacture Part Number 1: ADP123AUJZ-R7; Pin Count: 5; Mounting Technology: SMT; Component Kind: Standard; Component Type: Standard; PP Rotation: 0; Footprint: SOT23-5

## Sheet CW341_HyperRam.SchDoc: CW341 HypeRAM
size Letter; Organization: NewAE Technology Inc.; Address1: 1083 Queen St., Suite 196; Address2: Halifax; Address3: NS; Address4: Canada B3H 0B2; SheetNumber: 15; SheetTotal: 16; SheetApproved: YES
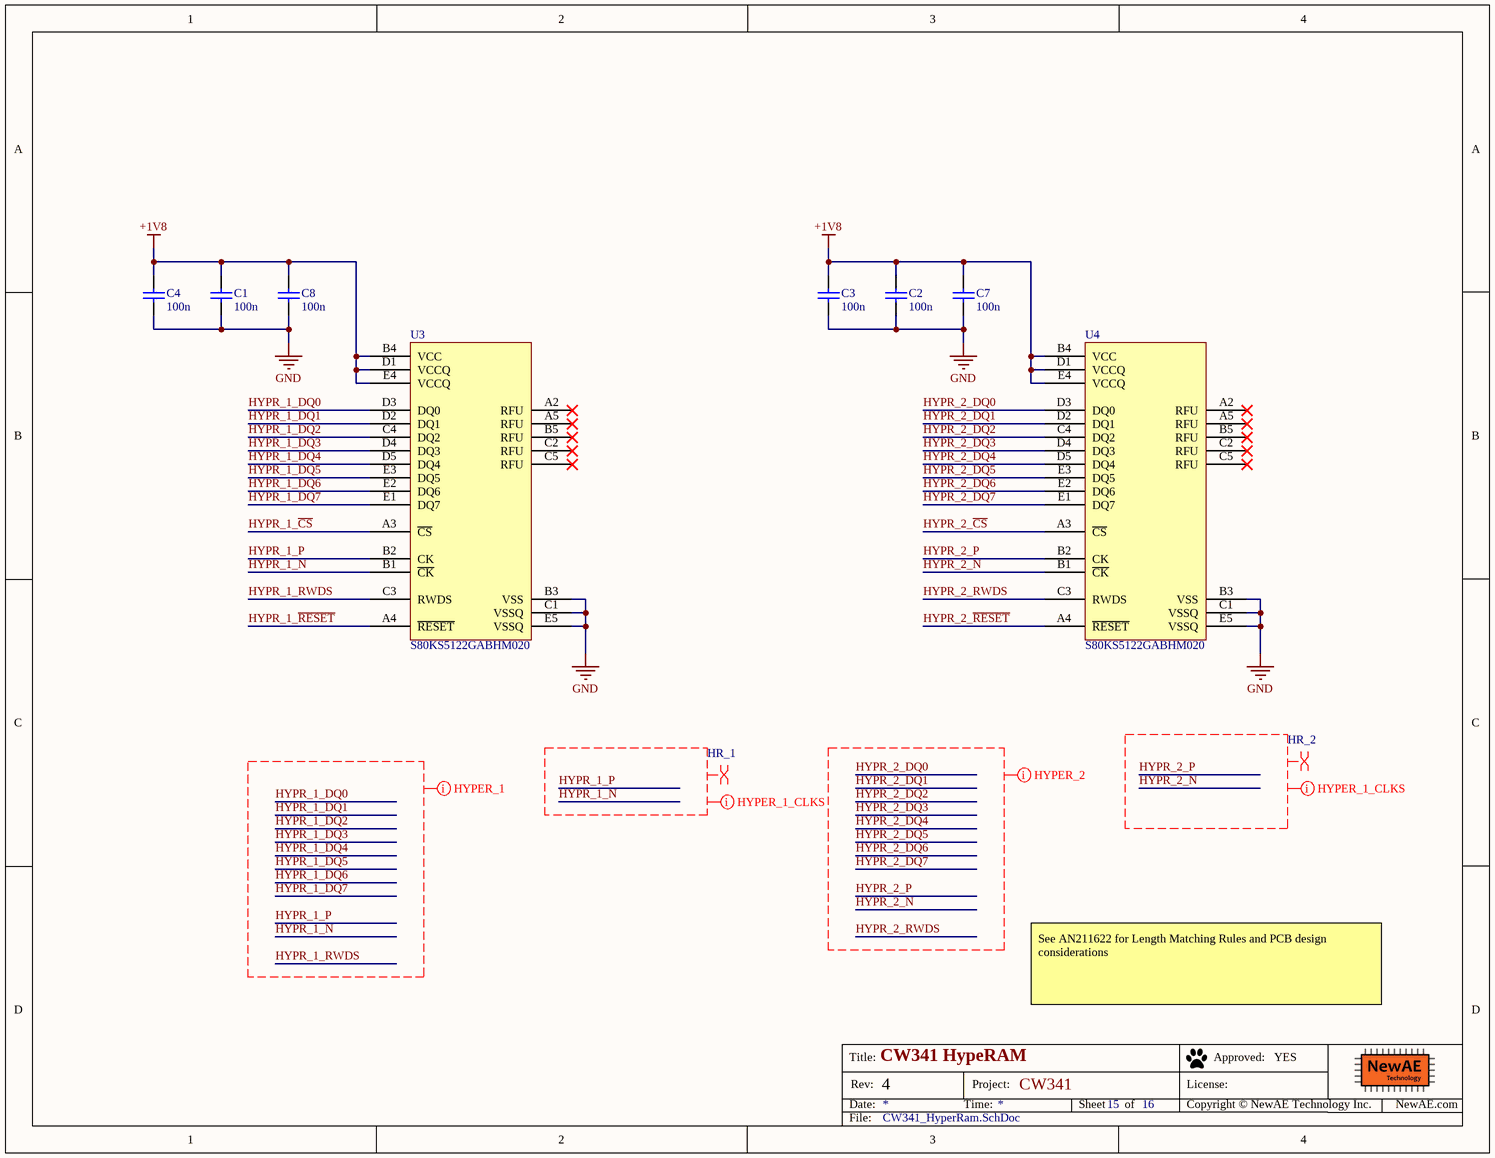
[diagram p15: CW341_HyperRam.SchDoc]

### Parts
C1  100n  [CAPC0402_M]
C2  100n  [CAPC0402_M]
C3  100n  [CAPC0402_M]
C4  100n  [CAPC0402_M]
C7  100n  [CAPC0402_M]
C8  100n  [CAPC0402_M]
U3  PSRAM 512MBIT HYPERBUS 24FBGA  [BGA_24-TBGA_HYPERRAM]  (value not drawn)
U4  PSRAM 512MBIT HYPERBUS 24FBGA  [BGA_24-TBGA_HYPERRAM]  (value not drawn)

### Nets
+1V8: C1.1 C2.1 C3.1 C4.1 C7.1 C8.1 U3.B4(VCC) U3.D1(VCCQ) U3.E4(VCCQ) U4.B4(VCC) U4.D1(VCCQ) U4.E4(VCCQ)
GND: C1.2 C2.2 C3.2 C4.2 C7.2 C8.2 U3.B3(VSS) U3.C1(VSSQ) U3.E5(VSSQ) U4.B3(VSS) U4.C1(VSSQ) U4.E5(VSSQ)
HYPR_1_~{CS}: U3.A3(~{CS})
HYPR_1_DQ0: U3.D3(DQ0)
HYPR_1_DQ1: U3.D2(DQ1)
HYPR_1_DQ2: U3.C4(DQ2)
HYPR_1_DQ3: U3.D4(DQ3)
HYPR_1_DQ4: U3.D5(DQ4)
HYPR_1_DQ5: U3.E3(DQ5)
HYPR_1_DQ6: U3.E2(DQ6)
HYPR_1_DQ7: U3.E1(DQ7)
HYPR_1_N: U3.B1(~{CK})
HYPR_1_P: U3.B2(CK)
HYPR_1_~{RESET}: U3.A4(~{RESET})
HYPR_1_RWDS: U3.C3(RWDS)
HYPR_2_~{CS}: U4.A3(~{CS})
HYPR_2_DQ0: U4.D3(DQ0)
HYPR_2_DQ1: U4.D2(DQ1)
HYPR_2_DQ2: U4.C4(DQ2)
HYPR_2_DQ3: U4.D4(DQ3)
HYPR_2_DQ4: U4.D5(DQ4)
HYPR_2_DQ5: U4.E3(DQ5)
HYPR_2_DQ6: U4.E2(DQ6)
HYPR_2_DQ7: U4.E1(DQ7)
HYPR_2_N: U4.B1(~{CK})
HYPR_2_P: U4.B2(CK)
HYPR_2_~{RESET}: U4.A4(~{RESET})
HYPR_2_RWDS: U4.C3(RWDS)

Not connected (* = marked no-connect by the designer): U3 A2(RFU)* A5(RFU)* B5(RFU)* C2(RFU)* C5(RFU)*; U4 A2(RFU)* A5(RFU)* B5(RFU)* C2(RFU)* C5(RFU)*

### Layout directives
net class HYPER_1_Length: HYPR_1_DQ0, HYPR_1_DQ1, HYPR_1_DQ2, HYPR_1_DQ3, HYPR_1_DQ4, HYPR_1_DQ5, HYPR_1_DQ6, HYPR_1_DQ7, HYPR_1_N, HYPR_1_P, HYPR_1_RWDS
differential pair; differential pair class HR_1: HYPR_1_N, HYPR_1_P
net class HYPER_1_Clks: HYPR_1_N, HYPR_1_P
net class HYPER_2_Length: HYPR_2_DQ0, HYPR_2_DQ1, HYPR_2_DQ2, HYPR_2_DQ3, HYPR_2_DQ4, HYPR_2_DQ5, HYPR_2_DQ6, HYPR_2_DQ7, HYPR_2_N, HYPR_2_P, HYPR_2_RWDS
differential pair; differential pair class HR_2: HYPR_2_N, HYPR_2_P
net class HYPER_2_Clks: HYPR_2_N, HYPR_2_P

### Notes on the sheet
- See AN211622 for Length Matching Rules and PCB design considerations
- Title:
- Date:
- Rev:
- Time:
- Project:
- Sheet
- of
- License:
- Copyright © NewAE Technology Inc.
- Approved:
- NewAE.com
- File:

### Library data of the parts
C1-C4 C7 C8 = CCHIP-100n-0402: as C10 on sheet CW341_XADC; Part Number: CCHIP-100n-0402; Footprint: 0402; Pin Count: 2; Value: 100n; Mounting Technology: SMT; Component Kind: Standard; Component Type: Standard; Supplier 1: Digi-Key; Supplier Part Number 1: 445-6901-1-ND
U3 U4 = S80KS5122GABHM020: IC PSRAM 512MBIT HYPERBUS 24FBGA; Manufacture 1: Infineon Technologies; Operating Supply Voltage: 1.7V~2V; Access Time: 35ns; Address Bus Width: 8b; Max Supply Voltage: 2.5V; Min Supply Voltage: 0V; Memory Type: RAM,SRAM - Asynchronous,SDR; Memory Size: 512Mb; Max Supply Current: 44mA; Number of Ports: 1; Component Group: Digital IC; PP Material Stack: 0; Supplier 1: Digi-Key; RoHS: Yes; Category: RAM; Stock 1: 1798; Pricing 1: 1=6.76000, 10=6.21600, 25=6.08640, 50=6.06560, 135=5.44252, 270=5.27800, 540=5.01900, 1080=4.84400, 5130=4.35750 (USD); Mount: Surface Mount; Case/Package: 24-VBGA; Number of Pins: 24; Min Operating Temperature: -40°C; Max Operating Temperature: 125°C; Package Quantity: 0; Interface: HyperBus; Density: 512Mbit; Packaging: Tray; Length: 8mm; Width: 6mm; Height: 1mm; Radiation Hardening: No; REACH SVHC: No SVHC; Lead Free: Lead Free; ComponentLink3URL: https://www.infineon.com/dgdl/Infineon-S80KS5122_1.8_V_512-Mbit_HyperBus_Interface_HyperRAM_(Self-Refresh_DRAM)-DataSheet-v01_00-EN.pdf?fileId=8ac78c8c7dc4255f017dd81b77c1088f; ComponentLink3Description: https://datasheet.ciiva.com/9274/as6c8008-9274921.pdf?src-supplier=Avnet; ComponentLink4URL: https://www.infineon.com/dgdl/Infineon-S80KS5122_1.8_V_512-Mbit_HyperBus_Interface_HyperRAM_(Self-Refresh_DRAM)-DataSheet-v01_00-EN.pdf?fileId=8ac78c8c7dc4255f017dd81b77c1088f; ComponentLink4Description: https://datasheet.ciiva.com/1510/32786-1510631.pdf?src-supplier=Element14; Supplier Part Number 1: 1450-1039-ND; .Checked SCH: *; .Checked PCB: *; Part Number: S80KS5122GABHM020; Footprint: TSSOP-44; Manufacture Part Number 1: S80KS5122GABHM020; Pin Count: 24; Mounting Technology: SMT; Component Kind: Standard; Component Type: Standard; PP Rotation: 0; Manufacturer Part Number: S80KS5122GABHM020

## Sheet CW341_FPGA_USERIOA.SchDoc: <Enter Sheet Title>
size Letter; Organization: NewAE Technology Inc.; Address1: 1083 Queen St., Suite 196; Address2: Halifax; Address3: NS; Address4: Canada B3H 0B2; SheetNumber: 16; SheetTotal: 16; SheetApproved: YES
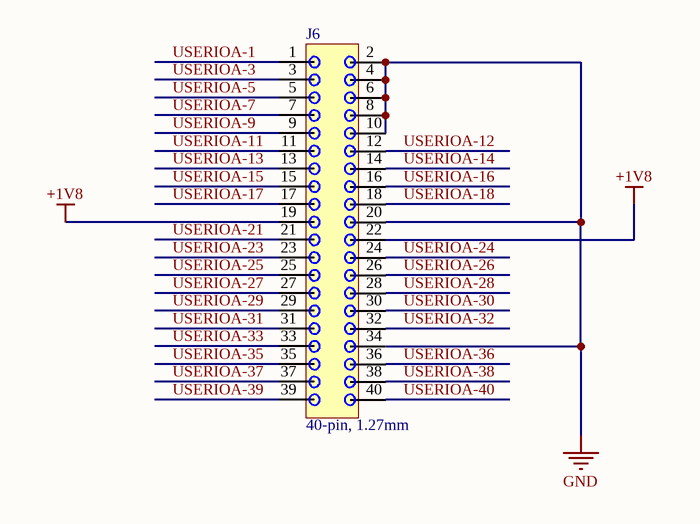
[diagram p16: CW341_FPGA_USERIOA.SchDoc]

### Parts
J6  40-pin, 1.27mm  [SHF-120-01-X-D-SM]

### Nets
+1V8: J6.19 J6.22
GND: J6.2 J6.4 J6.6 J6.8 J6.10 J6.20 J6.34
USERIOA-1: J6.1
USERIOA-3: J6.3
USERIOA-5: J6.5
USERIOA-7: J6.7
USERIOA-9: J6.9
USERIOA-11: J6.11
USERIOA-12: J6.12
USERIOA-13: J6.13
USERIOA-14: J6.14
USERIOA-15: J6.15
USERIOA-16: J6.16
USERIOA-17: J6.17
USERIOA-18: J6.18
USERIOA-21: J6.21
USERIOA-23: J6.23
USERIOA-24: J6.24
USERIOA-25: J6.25
USERIOA-26: J6.26
USERIOA-27: J6.27
USERIOA-28: J6.28
USERIOA-29: J6.29
USERIOA-30: J6.30
USERIOA-31: J6.31
USERIOA-32: J6.32
USERIOA-33: J6.33
USERIOA-35: J6.35
USERIOA-36: J6.36
USERIOA-37: J6.37
USERIOA-38: J6.38
USERIOA-39: J6.39
USERIOA-40: J6.40

### Notes on the sheet
- Title:
- Date:
- Rev:
- Time:
- Project:
- Sheet
- of
- License:
- Copyright © NewAE Technology Inc.
- Approved:
- NewAE.com
- File:

### Library data of the parts
J6 = CONN_40POS_1.27MM_SHROUDED: Manufacture 1: Samtec; Manufacture Part Number 1: SHF-120-01-L-D-SM; Component Group: Connector; PP Material Stack: 0; Part Number: CONN_40POS_1.27MM_SHROUDED; Pin Count: 40; Supplier 1: Digi-Key; Supplier Part Number 1: SAM9922-ND; Component Kind: Standard; Component Type: Standard; PP Rotation: 0; PP Rotation1: 0